# Altium schematic sheet 02.C203. A01-A73. Module BASU AC power .SchDoc: Кабель питания 220В
size 209 x 297 mm; Author: Мурашкин Д.В.; Address1: Address1; Address2: Address2; Address3: Address3; Address4: Address4; DocumentNumber: ИЗДЕЛИЕ-1-2; SheetNumber: 15; Scale: 1:1; Letter1Column: Э
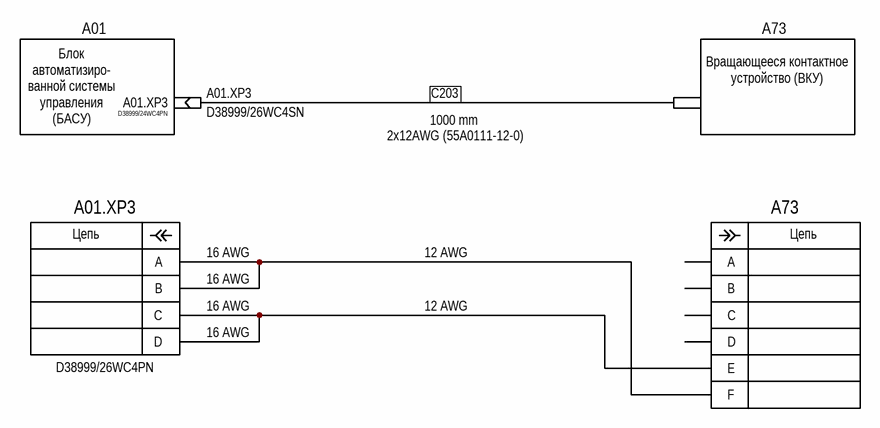
[diagram p0: 02.C203. A01-A73. Module BASU AC power .SchDoc]

## Parts
(Parts that share a designator on the sheet are numbered #1, #2 ... from top to bottom, then left to right.)
A01.XP3#1  D38999/24WC4PN
A01.XP3#2  D38999/26WC4SN
A01.XP3#3  D38999/26WC4PN
A73  (no value)
A73.XC3  Провод  (value not drawn)  (no BOM)

## Nets
С203: A01.XP3#2.0 A73.XC3.0
NetA01.XP3#3_A: A01.XP3#3.A A01.XP3#3.B A73.F
NetA01.XP3#3_C: A01.XP3#3.C A01.XP3#3.D A73.E

Not connected (* = marked no-connect by the designer): A01.XP3#1 0; A73 A B C D

## Notes on the sheet
- A01
- A73
- (near A73.XC3) Вращающееся контактное устройство (ВКУ)
- Блок автоматизиро- ванной системы управления (БАСУ)
- 2x12AWG (55A0111-12-0)
- 1000 mm
- (near A01.XP3#3) 16 AWG
- 12 AWG
- Перв. примен.
- Справ. №
- Подп. и дата
- Инв. № дубл.
- Взам. инв. №
- Инв. № подл.
- Изм.
- Лист
- № докум.
- Подп.
- Дата
- 2.106-A4
- Копировал
- Формат А4
- (in symbol Connector signal P5_1) Цепь
- (in symbol Connector signal P6) Цепь

## Library data of the parts
A01.XP3#1 = Connector cable socket: Operating temperature: -°C +°C; Mounting type: Surface mount; Dimension: .0mm x .0mm; Height: .0mm
A01.XP3#2 = Connector cable plug: Operating temperature: -°C +°C; Mounting type: Surface mount; Dimension: .0mm x .0mm; Height: .0mm
A01.XP3#3 = Connector signal P5_1: P4 MIL; Operating temperature: -°C +°C; Mounting type: Surface mount; Dimension: .0mm x .0mm; Height: .0mm
A73 = Connector signal P6: P6 MIL; Operating temperature: -°C +°C; Mounting type: Surface mount; Dimension: .0mm x .0mm; Height: .0mm
A73.XC3 = Connector cable coupling: Operating temperature: -°C +°C; Mounting type: Surface mount; Dimension: .0mm x .0mm; Height: .0mm